# Altium project 环境监测系统工程.PrjPcb
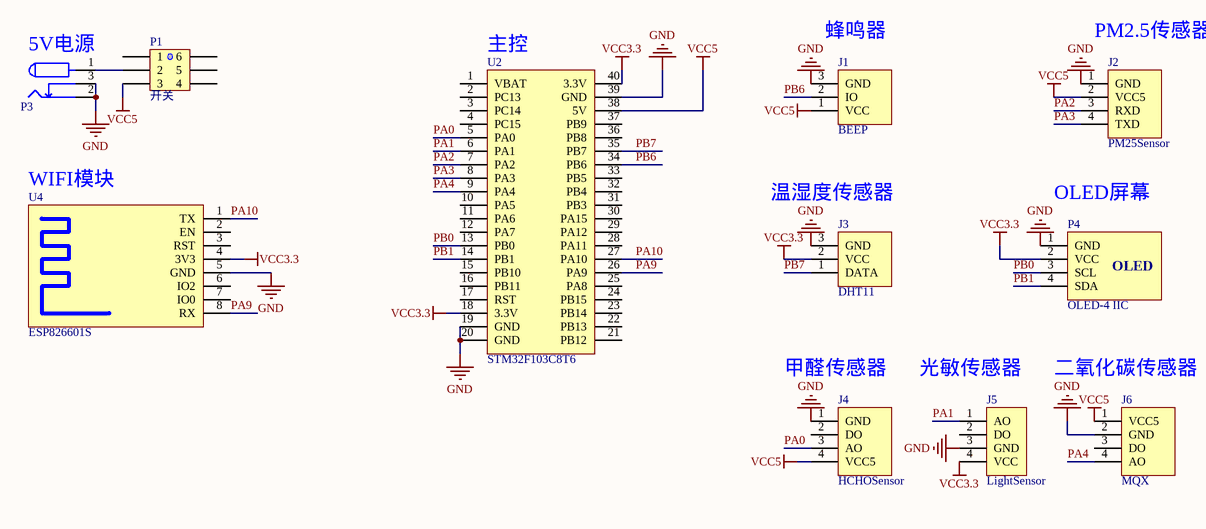
[diagram p0: 环境监测系统原理图.SchDoc]
1 sheet, 11 parts. Net scope: global (net labels, ports and power ports of the same name join across sheets).
Board file: 环境监测系统PCB.PcbDoc

## Sheet 环境监测系统原理图.SchDoc
size A4

### Parts
J1  BEEP  [BEEP]
J2  PM25Sensor  [PM25Sensor]
J3  DHT11  [DHT11]
J4  HCHOSensor  [HCHOSensor]
J5  LightSensor  [LightSensor]
J6  MQX  [MQX]
P1  开关  [KFT DIP-7X7]
P3  电源插座  [DC-002]  (value not drawn)
P4  OLED-4 IIC  [OLED 0.96-4P]
U2  STM32F103C8T6  [STM32F103C8T6]
U4  ESP826601S  [ESP-01S]

### Nets
GND: J1.3(GND) J2.1(GND) J3.3(GND) J4.1(GND) J5.3(GND) J6.2(GND) P3.2 P3.3 P4.1(GND) U2.19(GND) U2.20(GND) U2.39(GND) U4.5(GND)
VCC3.3: J3.2(VCC) J5.4(VCC) P4.2(VCC) U2.18(3.3V) U2.40(3.3V) U4.4(3V3)
VCC5: J1.1(VCC) J2.2(VCC5) J4.4(VCC5) J6.1(VCC5) P1.3 U2.38(5V)
PA0: J4.3(AO) U2.5(PA0)
PA1: J5.1(AO) U2.6(PA1)
PA2: J2.3(RXD) U2.7(PA2)
PA3: J2.4(TXD) U2.8(PA3)
PA4: J6.4(AO) U2.9(PA4)
PA9: U2.26(PA9) U4.8(RX)
PA10: U2.27(PA10) U4.1(TX)
PB0: P4.3(SCL) U2.13(PB0)
PB1: P4.4(SDA) U2.14(PB1)
PB6: J1.2(IO) U2.34(PB6)
PB7: J3.1(DATA) U2.35(PB7)
NetP1_2: P1.2 P3.1

Not connected (* = marked no-connect by the designer): J4 2(DO); J5 2(DO); J6 3(DO); P1 1 4 5 6; U2 1(VBAT) 2(PC13) 3(PC14) 4(PC15) 10(PA5) 11(PA6) 12(PA7) 15(PB10) 16(PB11) 17(RST) 21(PB12) 22(PB13) 23(PB14) 24(PB15) 25(PA8) 28(PA11) 29(PA12) 30(PA15) 31(PB3) 32(PB4) 33(PB5) 36(PB8) 37(PB9); U4 2(EN) 3(RST) 6(IO2) 7(IO0)

### Notes on the sheet
- (near J1) 蜂鸣器
- (near J2) PM2.5传感器
- (near P3) 5V电源
- (near U2) 主控
- WIFI模块
- (near J3) 温湿度传感器
- OLED屏幕
- (near J4) 甲醛传感器
- (near J5) 光敏传感器
- (near J6) 二氧化碳传感器
- (in symbol OLED-4 IIC) OLED

### Library data of the parts
J1 = BEEP: 蜂鸣器
J2 = PM25Sensor: PM25传感器
J3 = DHT11: 温湿度传感器
J4 = HCHOSensor: 甲醛传感器
J5 = LightSensor: 光敏传感器
J6 = MQX: 二氧化碳传感器; BOM名称: 4P接插件; 版权归属: 封装库来自淘宝 ID：黄晶宝石; 学习资源: https://shop463601444.taobao.com
P1 = Switch
P3 = POWER: 3PIN
P4 = OLED-4 IIC: 4PIN
U2 = STM32F103C8T6: 40PIN